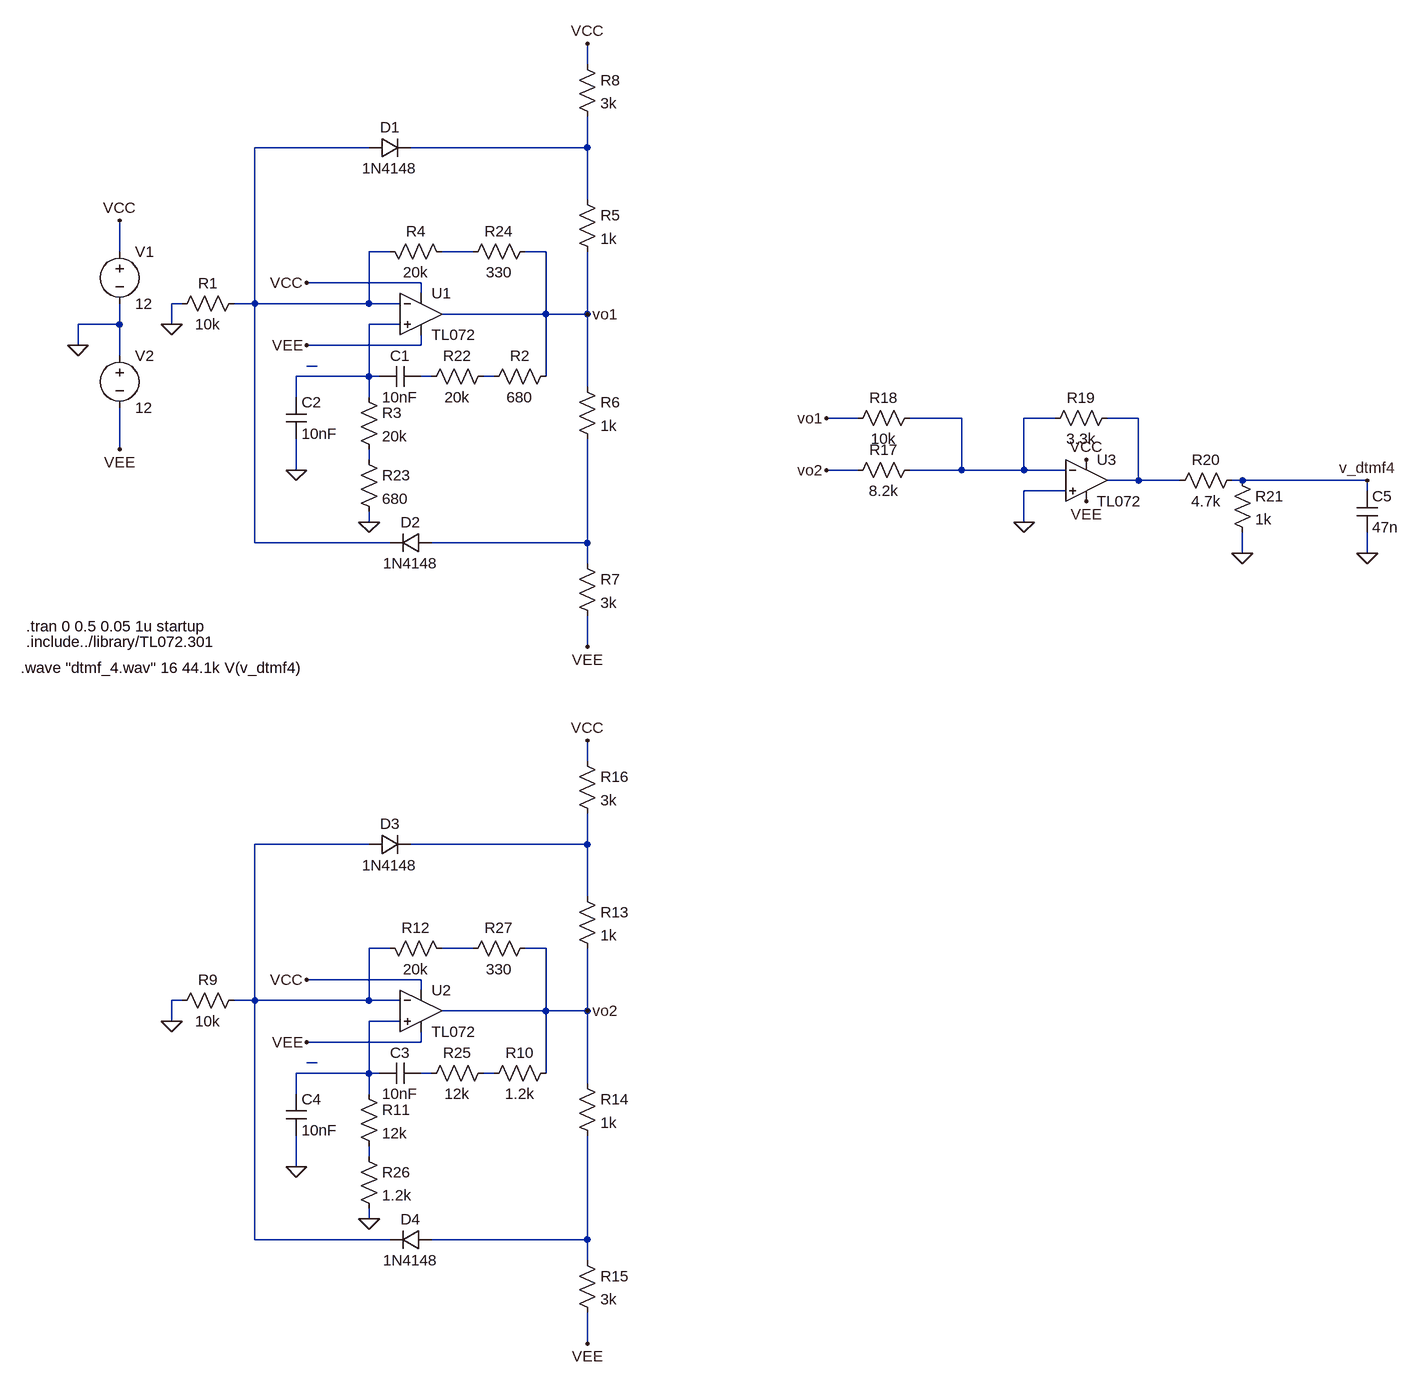
[diagram p0: schematic osilator.asc]
osilator.asc, the LTspice schematic file:
Version 4.1
SHEET 1 1556 1432
WIRE 288 -624 288 -656
WIRE -48 -496 -224 -496
WIRE 288 -496 288 -544
WIRE 288 -496 16 -496
WIRE 288 -416 288 -496
WIRE -432 -336 -432 -384
WIRE -16 -336 -48 -336
WIRE 112 -336 64 -336
WIRE 224 -336 192 -336
WIRE 32 -288 -144 -288
WIRE 32 -272 32 -288
WIRE -336 -256 -352 -256
WIRE -224 -256 -224 -496
WIRE -224 -256 -256 -256
WIRE -48 -256 -48 -336
WIRE -48 -256 -224 -256
WIRE 0 -256 -48 -256
WIRE 224 -240 224 -336
WIRE 224 -240 64 -240
WIRE 288 -240 288 -336
WIRE 288 -240 224 -240
WIRE -432 -224 -432 -256
WIRE -432 -224 -496 -224
WIRE -352 -224 -352 -256
WIRE 0 -224 -48 -224
WIRE -496 -192 -496 -224
WIRE 32 -192 32 -208
WIRE 32 -192 -144 -192
WIRE -432 -176 -432 -224
WIRE -128 -160 -144 -160
WIRE -48 -144 -48 -224
WIRE -48 -144 -160 -144
WIRE -32 -144 -48 -144
WIRE 48 -144 32 -144
WIRE 144 -144 128 -144
WIRE 224 -144 224 -240
WIRE 288 -128 288 -240
WIRE -160 -112 -160 -144
WIRE -48 -112 -48 -144
WIRE 704 -80 656 -80
WIRE 864 -80 784 -80
WIRE 1008 -80 960 -80
WIRE 1136 -80 1088 -80
WIRE -432 -32 -432 -96
WIRE -48 -16 -48 -32
WIRE -160 0 -160 -48
WIRE 704 0 656 0
WIRE 864 0 864 -80
WIRE 864 0 784 0
WIRE 960 0 960 -80
WIRE 960 0 864 0
WIRE 1024 0 960 0
WIRE 1136 16 1136 -80
WIRE 1136 16 1088 16
WIRE 1200 16 1136 16
WIRE 1296 16 1280 16
WIRE 1488 16 1296 16
WIRE 1024 32 960 32
WIRE 1488 32 1488 16
WIRE -48 80 -48 64
WIRE 960 80 960 32
WIRE -224 112 -224 -256
WIRE -16 112 -224 112
WIRE 288 112 288 -48
WIRE 288 112 48 112
WIRE 1296 128 1296 96
WIRE 1488 128 1488 96
WIRE 288 144 288 112
WIRE 288 272 288 224
WIRE 288 448 288 416
WIRE -48 576 -224 576
WIRE 288 576 288 528
WIRE 288 576 16 576
WIRE 288 656 288 576
WIRE -16 736 -48 736
WIRE 112 736 64 736
WIRE 224 736 192 736
WIRE 32 784 -144 784
WIRE 32 800 32 784
WIRE -336 816 -352 816
WIRE -224 816 -224 576
WIRE -224 816 -256 816
WIRE -48 816 -48 736
WIRE -48 816 -224 816
WIRE 0 816 -48 816
WIRE 224 832 224 736
WIRE 224 832 64 832
WIRE 288 832 288 736
WIRE 288 832 224 832
WIRE -352 848 -352 816
WIRE 0 848 -48 848
WIRE 32 880 32 864
WIRE 32 880 -144 880
WIRE -128 912 -144 912
WIRE -48 928 -48 848
WIRE -48 928 -160 928
WIRE -32 928 -48 928
WIRE 48 928 32 928
WIRE 144 928 128 928
WIRE 224 928 224 832
WIRE 288 944 288 832
WIRE -160 960 -160 928
WIRE -48 960 -48 928
WIRE -48 1056 -48 1040
WIRE -160 1072 -160 1024
WIRE -48 1152 -48 1136
WIRE -224 1184 -224 816
WIRE -16 1184 -224 1184
WIRE 288 1184 288 1024
WIRE 288 1184 48 1184
WIRE 288 1216 288 1184
WIRE 288 1344 288 1296
FLAG -352 -224 0
FLAG -48 80 0
FLAG -160 0 0
FLAG -496 -192 0
FLAG -432 -384 VCC
FLAG -144 -288 VCC
FLAG -432 -32 VEE
FLAG -144 -192 VEE
FLAG 288 -656 VCC
FLAG 288 272 VEE
FLAG 288 -240 vo1
FLAG 656 -80 vo1
FLAG 656 0 vo2
FLAG 960 80 0
FLAG 1056 -16 VCC
FLAG 1056 48 VEE
FLAG 1488 16 v_dtmf4
FLAG 1488 128 0
FLAG 1296 128 0
FLAG -352 848 0
FLAG -48 1152 0
FLAG -160 1072 0
FLAG -144 784 VCC
FLAG -144 880 VEE
FLAG 288 416 VCC
FLAG 288 1344 VEE
FLAG 288 832 vo2
SYMBOL OpAmps\\opamp2 32 -304 R0
SYMATTR InstName U1
SYMATTR Value TL072
SYMBOL res -240 -272 R90
WINDOW 0 0 56 VBottom 2
WINDOW 3 32 56 VTop 2
SYMATTR InstName R1
SYMATTR Value 10k
SYMBOL res 240 -160 R90
WINDOW 0 0 56 VBottom 2
WINDOW 3 32 56 VTop 2
SYMATTR InstName R2
SYMATTR Value 680
SYMBOL cap 32 -160 R90
WINDOW 0 0 32 VBottom 2
WINDOW 3 32 32 VTop 2
SYMATTR InstName C1
SYMATTR Value 10nF
SYMBOL res -64 -128 R0
SYMATTR InstName R3
SYMATTR Value 20k
SYMBOL cap -176 -112 R0
SYMATTR InstName C2
SYMATTR Value 10nF
SYMBOL res 80 -320 M270
WINDOW 0 32 56 VTop 2
WINDOW 3 0 56 VBottom 2
SYMATTR InstName R4
SYMATTR Value 20k
SYMBOL voltage -432 -352 R0
WINDOW 123 0 0 Left 0
WINDOW 39 0 0 Left 0
SYMATTR InstName V1
SYMATTR Value 12
SYMBOL voltage -432 -192 R0
SYMATTR InstName V2
SYMATTR Value 12
SYMBOL res 272 -432 R0
SYMATTR InstName R5
SYMATTR Value 1k
SYMBOL res 272 -144 R0
SYMATTR InstName R6
SYMATTR Value 1k
SYMBOL res 272 128 R0
SYMATTR InstName R7
SYMATTR Value 3k
SYMBOL res 272 -640 R0
SYMATTR InstName R8
SYMATTR Value 3k
SYMBOL diode -48 -480 R270
WINDOW 0 32 32 VTop 2
WINDOW 3 0 32 VBottom 2
SYMATTR InstName D1
SYMATTR Value 1N4148
SYMBOL diode 48 96 R90
WINDOW 0 0 32 VBottom 2
WINDOW 3 32 32 VTop 2
SYMATTR InstName D2
SYMATTR Value 1N4148
SYMBOL OpAmps\\opamp2 1056 -48 R0
SYMATTR InstName U3
SYMATTR Value TL072
SYMBOL res 800 -16 R90
WINDOW 0 0 56 VBottom 2
WINDOW 3 32 56 VTop 2
SYMATTR InstName R17
SYMATTR Value 8.2k
SYMBOL res 800 -96 R90
WINDOW 0 0 56 VBottom 2
WINDOW 3 32 56 VTop 2
SYMATTR InstName R18
SYMATTR Value 10k
SYMBOL res 1104 -96 R90
WINDOW 0 0 56 VBottom 2
WINDOW 3 32 56 VTop 2
SYMATTR InstName R19
SYMATTR Value 3.3k
SYMBOL res 1296 0 R90
WINDOW 0 0 56 VBottom 2
WINDOW 3 32 56 VTop 2
SYMATTR InstName R20
SYMATTR Value 4.7k
SYMBOL cap 1472 32 R0
SYMATTR InstName C5
SYMATTR Value 47n
SYMBOL res 1280 0 R0
SYMATTR InstName R21
SYMATTR Value 1k
SYMBOL res 144 -160 R90
WINDOW 0 0 56 VBottom 2
WINDOW 3 32 56 VTop 2
SYMATTR InstName R22
SYMATTR Value 20k
SYMBOL res -64 -32 R0
SYMATTR InstName R23
SYMATTR Value 680
SYMBOL res 208 -352 R90
WINDOW 0 0 56 VBottom 2
WINDOW 3 32 56 VTop 2
SYMATTR InstName R24
SYMATTR Value 330
SYMBOL OpAmps\\opamp2 32 768 R0
SYMATTR InstName U2
SYMATTR Value TL072
SYMBOL res -240 800 R90
WINDOW 0 0 56 VBottom 2
WINDOW 3 32 56 VTop 2
SYMATTR InstName R9
SYMATTR Value 10k
SYMBOL res 240 912 R90
WINDOW 0 0 56 VBottom 2
WINDOW 3 32 56 VTop 2
SYMATTR InstName R10
SYMATTR Value 1.2k
SYMBOL cap 32 912 R90
WINDOW 0 0 32 VBottom 2
WINDOW 3 32 32 VTop 2
SYMATTR InstName C3
SYMATTR Value 10nF
SYMBOL res -64 944 R0
SYMATTR InstName R11
SYMATTR Value 12k
SYMBOL cap -176 960 R0
SYMATTR InstName C4
SYMATTR Value 10nF
SYMBOL res 80 752 M270
WINDOW 0 32 56 VTop 2
WINDOW 3 0 56 VBottom 2
SYMATTR InstName R12
SYMATTR Value 20k
SYMBOL res 272 640 R0
SYMATTR InstName R13
SYMATTR Value 1k
SYMBOL res 272 928 R0
SYMATTR InstName R14
SYMATTR Value 1k
SYMBOL res 272 1200 R0
SYMATTR InstName R15
SYMATTR Value 3k
SYMBOL res 272 432 R0
SYMATTR InstName R16
SYMATTR Value 3k
SYMBOL diode -48 592 R270
WINDOW 0 32 32 VTop 2
WINDOW 3 0 32 VBottom 2
SYMATTR InstName D3
SYMATTR Value 1N4148
SYMBOL diode 48 1168 R90
WINDOW 0 0 32 VBottom 2
WINDOW 3 32 32 VTop 2
SYMATTR InstName D4
SYMATTR Value 1N4148
SYMBOL res 144 912 R90
WINDOW 0 0 56 VBottom 2
WINDOW 3 32 56 VTop 2
SYMATTR InstName R25
SYMATTR Value 12k
SYMBOL res -64 1040 R0
SYMATTR InstName R26
SYMATTR Value 1.2k
SYMBOL res 208 720 R90
WINDOW 0 0 56 VBottom 2
WINDOW 3 32 56 VTop 2
SYMATTR InstName R27
SYMATTR Value 330
TEXT -576 264 Left 2 !.include../library/TL072.301
TEXT -576 240 Left 2 !.tran 0 0.5 0.05 1u startup
TEXT -584 304 Left 2 !.wave "dtmf_4.wav" 16 44.1k V(v_dtmf4)

The netlist it stands for:
* osilator.asc
X§U1 N004 N001 VCC VEE vo1 TL072  ; pins In+ In- V+ V- OUT
R1 N001 0 10k
R2 vo1 N007 680
C1 N006 N004 10nF
R3 N004 N010 20k
C2 N004 0 10nF
R4 N003 N001 20k
V1 VCC 0 12
V2 0 VEE 12
R5 N002 vo1 1k
R6 vo1 N011 1k
R7 N011 VEE 3k
R8 VCC N002 3k
D1 N001 N002 1N4148
D2 N011 N001 1N4148
X§U3 0 N008 VCC VEE N009 TL072  ; pins In+ In- V+ V- OUT
R17 N008 vo2 8.2k
R18 N008 vo1 10k
R19 N009 N008 3.3k
R20 v_dtmf4 N009 4.7k
C5 v_dtmf4 0 47n
R21 v_dtmf4 0 1k
R22 N007 N006 20k
R23 N010 0 680
R24 vo1 N003 330
X§U2 N015 N012 VCC VEE vo2 TL072  ; pins In+ In- V+ V- OUT
R9 N012 0 10k
R10 vo2 N018 1.2k
C3 N017 N015 10nF
R11 N015 N019 12k
C4 N015 0 10nF
R12 N014 N012 20k
R13 N013 vo2 1k
R14 vo2 N020 1k
R15 N020 VEE 3k
R16 VCC N013 3k
D3 N012 N013 1N4148
D4 N020 N012 1N4148
R25 N018 N017 12k
R26 N019 0 1.2k
R27 vo2 N014 330
.model D D
.lib standard.dio
.include../library/TL072.301
.tran 0 0.5 0.05 1u startup
.wave "dtmf_4.wav" 16 44.1k V(v_dtmf4)
.backanno
.end